# Altium schematic sheet PFC-Sheet.SchDoc (part 3 of 4)
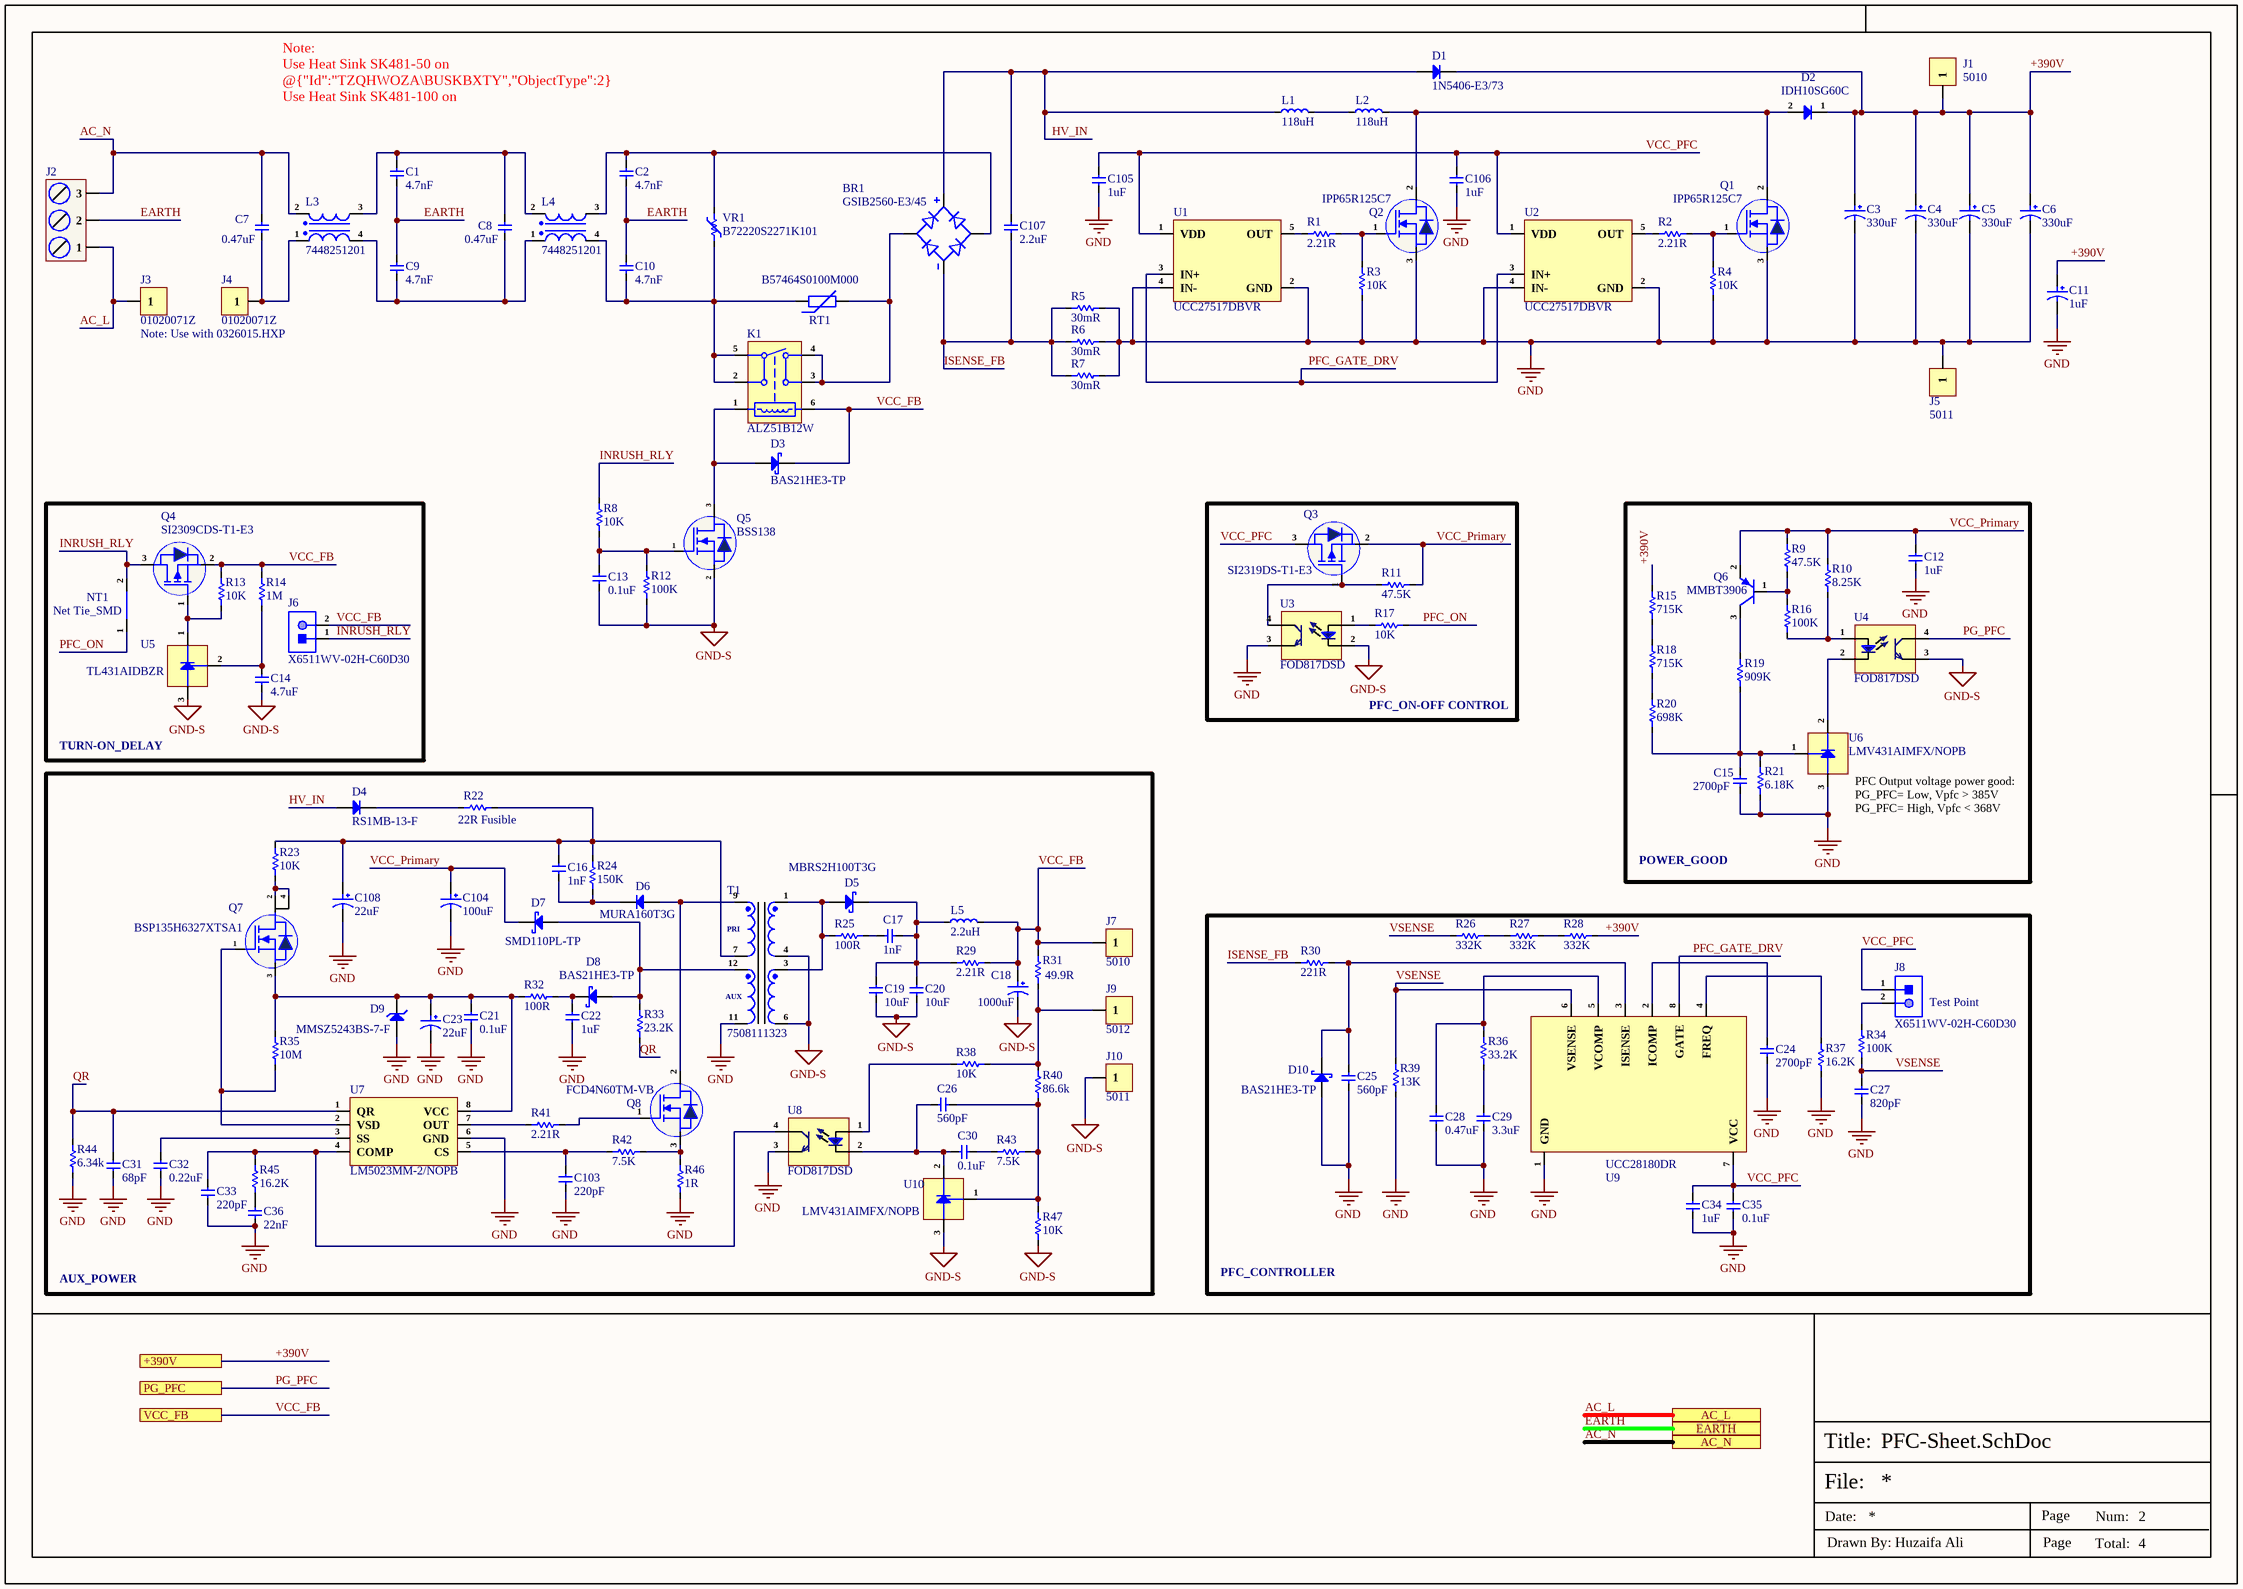
[diagram p2: PFC-Sheet.SchDoc]

## Library data of the parts (continued)
L1 L2 = 760801401: FIXED IND 118UH 13.9A 0.022OHM; Manufacturer: Wurth Electronics; Item Type: Inductors; Supplier: Digikey; Supplier Part Number: 732-760801401-ND; Manufacturer Part Number: 760801401; RoHS: No; Stock: 36; Pricing: 1=18.9, 5=17.01, 10=15.12, 20=14.175, 100=13.2301 (USD)
L3 L4 = 7448251201: CMC 1MH 12A 2LN TH; Manufacturer: Wurth Electronics; Item Type: Inductors; Supplier: Digikey; Supplier Part Number: 732-1454-ND; Manufacturer Part Number: 7448251201; RoHS: Yes; Stock: 1202; Pricing: 1=6.33, 10=6.23, 50=4.94, 175=4.73006, 350=4.6368 (USD); ComponentLink1URL: https://datasheet.ciiva.com/6216/7448251201-6216302.pdf?src-supplier=Digikey; ComponentLink1Description: https://datasheet.ciiva.com/6216/7448251201-6216302.pdf?src-supplier=Digikey; ComponentLink2URL: https://datasheet.ciiva.com/4952/7448251201-46375-4952324.pdf?src-supplier=Mouser; ComponentLink2Description: https://datasheet.ciiva.com/4952/7448251201-46375-4952324.pdf?src-supplier=Mouser; ComponentLink3URL: https://datasheet.ciiva.com/11796/0900766b804acf5b-11796661.pdf?src-supplier=Rs; ComponentLink3Description: https://datasheet.ciiva.com/11796/0900766b804acf5b-11796661.pdf?src-supplier=Rs; ComponentLink4URL: https://datasheet.ciiva.com/7754/1736539-7754744.pdf?src-supplier=Element14; ComponentLink4Description: https://datasheet.ciiva.com/7754/1736539-7754744.pdf?src-supplier=Element14; ComponentLink5URL: https://datasheet.ciiva.com/7211/70416-7211268.pdf?src-supplier=Newark; ComponentLink5Description: https://datasheet.ciiva.com/7211/70416-7211268.pdf?src-supplier=Newark; ComponentLink6URL: https://datasheet.ciiva.com/14124/ue7448251201-de-14124967.pdf?src-supplier=Distrelec; ComponentLink6Description: https://datasheet.ciiva.com/14124/ue7448251201-de-14124967.pdf?src-supplier=Distrelec
L5 = 7447745022: FIXED IND 2.2UH 3.6A 36 MOHM SMD; Manufacturer: Wurth Electronics; Item Type: Inductors; Supplier: Digikey; Manufacturer Part Number: 7447745022; RoHS: Yes; Stock: 1399; Pricing: 1=1.87, 10=1.791, 50=1.612, 100=1.492, 500=1.433, 1000=1.313 (USD); ComponentLink1URL: https://datasheet.ciiva.com/4954/7447745022-70534-4954819.pdf?src-supplier=Mouser; ComponentLink1Description: https://datasheet.ciiva.com/4954/7447745022-70534-4954819.pdf?src-supplier=Mouser; ComponentLink2URL: https://datasheet.ciiva.com/30489/0900766b811bf6b7-30489497.pdf?src-supplier=Rs; ComponentLink2Description: https://datasheet.ciiva.com/30489/0900766b811bf6b7-30489497.pdf?src-supplier=Rs; ComponentLink3URL: https://datasheet.ciiva.com/7892/1736408-7892891.pdf?src-supplier=Element14; ComponentLink3Description: https://datasheet.ciiva.com/7892/1736408-7892891.pdf?src-supplier=Element14; ComponentLink4URL: https://datasheet.ciiva.com/6700/7447745022-6700388.pdf?src-supplier=Digikey; ComponentLink4Description: https://datasheet.ciiva.com/6700/7447745022-6700388.pdf?src-supplier=Digikey; ComponentLink5URL: https://datasheet.ciiva.com/6700/7447745022-6700390.pdf?src-supplier=Digikey; ComponentLink5Description: https://datasheet.ciiva.com/6700/7447745022-6700390.pdf?src-supplier=Digikey
NT1 = Net Tie_SMD: Net Tie SMD; Manufacturer Part Number: Net Tie; Item Type: Net Tie Pad
Q1 Q2 = IPP65R125C7: MOSFET N-CH 650V 18A TO220-3; Manufacturer: Infineon; Supplier: Mouser; Manufacturer Part Number: IPP65R125C7; RoHS: Yes; Item Type: Mosfet; Pricing: 1=4.05, 10=3.4, 50=2.58, 100=2.35, 1000=1.88, 10000=1.88 (USD); ComponentLink1URL: http://www.farnell.com/datasheets/1812585.pdf?src-supplier=Element14; ComponentLink1Description: http://www.farnell.com/datasheets/1812585.pdf?src-supplier=Element14; ComponentLink2URL: http://www.farnell.com/datasheets/1812585.pdf?src-supplier=Newark; ComponentLink2Description: http://www.farnell.com/datasheets/1812585.pdf?src-supplier=Newark
Q3 = SI2319DS-T1-E3: MOSFET P-CH 40V 2.3A SOT23-3; Manufacturer: Vishay Siliconix; Item Type: MOSFETs; Drain to Source Breakdown Voltage: -40V; Supplier: Mouser; LCSC Part Number: C727531; Manufacturer Part Number: SI2319DS-T1-E3; RoHS: Yes; Stock: 200176; Pricing: 1=0.55, 10=0.466, 50=0.466, 100=0.359, 1000=0.296, 10000=0.237 (USD); Lead Free: 5697LeadFree; ComponentLink1URL: https://datasheet.ciiva.com/28599/1749956-28599616.pdf?src-supplier=Element14; ComponentLink1Description: https://datasheet.ciiva.com/28599/1749956-28599616.pdf?src-supplier=Element14; ComponentLink2URL: https://datasheet.ciiva.com/16486/72315-16486091.pdf?src-supplier=Future+Electronics; ComponentLink2Description: https://datasheet.ciiva.com/16486/72315-16486091.pdf?src-supplier=Future+Electronics; ComponentLink3URL: https://datasheet.ciiva.com/7788/72315-7788760.pdf?src-supplier=Element14; ComponentLink3Description: https://datasheet.ciiva.com/7788/72315-7788760.pdf?src-supplier=Element14; ComponentLink4URL: https://datasheet.ciiva.com/932/72315-932453.pdf?src-supplier=Digikey; ComponentLink4Description: https://datasheet.ciiva.com/932/72315-932453.pdf?src-supplier=Digikey; ComponentLink5URL: https://datasheet.ciiva.com/932/72315-932454.pdf?src-supplier=Digikey; ComponentLink5Description: https://datasheet.ciiva.com/932/72315-932454.pdf?src-supplier=Digikey; ComponentLink6URL: https://datasheet.ciiva.com/932/72315-932455.pdf?src-supplier=Digikey; ComponentLink6Description: https://datasheet.ciiva.com/932/72315-932455.pdf?src-supplier=Digikey; ComponentLink7URL: https://datasheet.ciiva.com/11161/72315-11161455.pdf?src-supplier=Avnet; ComponentLink7Description: https://datasheet.ciiva.com/11161/72315-11161455.pdf?src-supplier=Avnet
Q4 = SI2309CDS-T1-E3: MOSFET P-CH 60V 1.6A SOT23-3; Manufacturer: Vishay Siliconix; Item Type: MOSFETs; Rise Time: 35ns; Rds On Max: 345mR; Input Capacitance: 210pF; Continuous Drain Current (ID): 1.2A; Max Power Dissipation: 1.7W; Gate to Source Voltage (Vgs): 20V; Turn-Off Delay Time: 15ns; Turn-On Delay Time: 40ns; Number of Channels: 1; Polarity: P-CHANNEL; Power Dissipation: 1W; Threshold Voltage: -1V; Supplier: Mouser; LCSC Part Number: C553975; Manufacturer Part Number: SI2309CDS-T1-E3; RoHS: Yes; Stock: 57582; Pricing: 1=0.53, 10=0.453, 50=0.453, 100=0.316, 1000=0.2, 10000=0.157 (USD); Mounting Technology: Surface Mount; Case/Package: SOT-23-3; Pins: 3; Weight: 0.050717oz; Min Operating Temperature: -55°C; Max Operating Temperature: 150°C; Packaging: Tape and Reel; Package Quantity: 3000; Drain to Source Voltage (Vdss): 60V; Drain to Source Resistance: 345mR; Fall Time: 35ns; Series: TrenchFET®; Drain-source On Resistance-Max: 345mR; Length: 3.04mm; Width: 1.4mm; Height: 1.02mm; Radiation Hardening: No; Lead Free: Lead Free; RoHS Compliant: Yes; ComponentLink1URL: https://datasheet.ciiva.com/16217/si2309cd-16217597.pdf?src-supplier=Future+Electronics; ComponentLink1Description: https://datasheet.ciiva.com/16217/si2309cd-16217597.pdf?src-supplier=Future+Electronics; ComponentLink2URL: https://datasheet.ciiva.com/29742/si2309cd-29742879.pdf?src-supplier=Digikey; ComponentLink2Description: https://datasheet.ciiva.com/29742/si2309cd-29742879.pdf?src-supplier=Digikey
Q5 = BSS138: 50V 220mA 3.5Ω@10V,220mA 225mW 1.6V@1mA N Channel SOT-23 MOSFETs ROHS; Manufacturer: Slkor(SLKORMICRO Elec.); Item Type: Mosfet; Manufacturer Part Number: BSS138; Package: SOT-23; LCSC Part Number: C426569; ComponentLink1Description: LCSC; ComponentLink1URL: https://www.lcsc.com/product-detail/MOSFETs_Slkor-SLKORMICRO-Elec-BSS138_C426569.html
Q6 = MMBT3906: 40V 300mW 200mA PNP SOT-23(TO-236) Bipolar Transistors - BJT ROHS; Manufacturer: YONGYUTAI; Manufacturer Part Number: MMBT3906; Package: SOT-23(TO-236); LCSC Part Number: C2891809; ComponentLink1Description: LCSC; ComponentLink1URL: https://www.lcsc.com/product-detail/Bipolar-Transistors-BJT_YONGYUTAI-MMBT3906_C2891809.html; Item Type: Transistor
Q7 = BSP135H6327XTSA1: Trans MOSFET N-CH 600V 0.12A Automotive 4-Pin(3+Tab) SOT-223; Manufacturer: Infineon; Item Type: MOSFETs; Supplier: Mouser; LCSC Part Number: C3278599; Manufacturer Part Number: BSP135H6327XTSA1; RoHS: Yes; Stock: 85947; Pricing: 1=1.31, 10=1.08, 50=1.08, 100=0.837, 1000=0.577, 10000=0.563 (USD)
Q8 = FCD4N60TM-VB: 650V 5A 950mΩ@10V 1 N-Channel TO-252 MOSFETs ROHS; Manufacturer: VBsemi Elec; Manufacturer Part Number: FCD4N60TM-VB; Package: TO-252; LCSC Part Number: C20755211; Item Type: MOSFETs; ComponentLink1Description: LCSC; ComponentLink1URL: https://www.lcsc.com/product-detail/MOSFETs_VBsemi-Elec-FCD4N60TM-VB_C20755211.html
R1 R2 R29 R41 = CRCW08052R21FKEA: RES SMD 2.21 OHM 1% 1/8W 0805; Manufacturer: Vishay Dale; Item Type: Resistor; Voltage Rating (DC): 150V; Supplier: Mouser; LCSC Part Number: C2085884; Manufacturer Part Number: CRCW08052R21FKEA; RoHS: Yes; Stock: 740; Pricing: 1=0.1, 10=0.033, 50=0.033, 100=0.02, 1000=0.015, 10000=0.01 (USD); Lead Free: 5697LeadFree; ComponentLink1URL: https://datasheet.ciiva.com/9090/dcrcwe3-9090039.pdf?src-supplier=Avnet; ComponentLink1Description: https://datasheet.ciiva.com/9090/dcrcwe3-9090039.pdf?src-supplier=Avnet; ComponentLink2URL: https://datasheet.ciiva.com/5588/dcrcwe3-109170-5588315.pdf?src-supplier=Mouser; ComponentLink2Description: https://datasheet.ciiva.com/5588/dcrcwe3-109170-5588315.pdf?src-supplier=Mouser; ComponentLink3URL: https://datasheet.ciiva.com/2467/dcrcwe3-2467362.pdf?src-supplier=Digikey; ComponentLink3Description: https://datasheet.ciiva.com/2467/dcrcwe3-2467362.pdf?src-supplier=Digikey; ComponentLink4URL: https://datasheet.ciiva.com/2467/dcrcwe3-2467363.pdf?src-supplier=Digikey; ComponentLink4Description: https://datasheet.ciiva.com/2467/dcrcwe3-2467363.pdf?src-supplier=Digikey; ComponentLink5URL: https://datasheet.ciiva.com/2467/dcrcwe3-2467364.pdf?src-supplier=Digikey; ComponentLink5Description: https://datasheet.ciiva.com/2467/dcrcwe3-2467364.pdf?src-supplier=Digikey
R3 R4 R8 R13 R17 R38 R47 = RK73G1JTTD1002F: RES 10K OHM 1% 1/10W 0603; Item Type: Resistor; Value: 10kR; Power Rating: 100mW; Voltage Rating: 75V; Temperature Coefficient: 50ppm/°C; LCSC Part Number: C362180; ComponentLink1Description: LCSC; Supplier: Digi-Key; Supplier Part Number: 2019-RK73G1JTTD1002FCT-ND; RoHS: Yes; Category: Chip SMD Resistors; Stock: 249394; Pricing: 1=0.22, 10=0.118, 50=0.0812, 100=0.0699, 500=0.0513, 1000=0.04545 (USD); Case/Package: 0603; Case Code (Imperial): 0603; Case Code (Metric): 1608; Min Operating Temperature: -55°C; Max Operating Temperature: 125°C; Tolerance: 1%; Packaging: Tape and Reel; Termination: SMD/SMT; Series: RK73G; Construction: Rectangular; Length: 1.6mm; Depth: 0.8mm; Military Standard: Not; RoHS Compliant: Yes; ComponentLink2URL: http://www.mouser.com/ds/2/219/RK73G-9863.pdf?src-supplier=Mouser; ComponentLink2Description: http://www.mouser.com/ds/2/219/RK73G-9863.pdf?src-supplier=Mouser
R5-R7 = PA2512FKE7W0R03E: RES 0.03 OHM 1% 2W 2512; Manufacturer: Yageo; Item Type: Resistor; Supplier: Avnet; LCSC Part Number: C728311; Manufacturer Part Number: PA2512FKE7W0R03E; RoHS: No; Stock: 4000; Pricing: 1=0.655, 25=0.542, 50=0.453, 100=0.364, 250=0.314 (USD)
R9 = CRCW060347K5FKEA: RES SMD 47.5K OHM 1% 1/10W 0603; Manufacturer: Vishay; Item Type: Resistors; Value: 47.5kR; Temperature Coefficient: 100ppm/°C; Max Power Dissipation: 100mW; Voltage Rating: 75V; Supplier: Mouser; LCSC Part Number: C844568; Manufacturer Part Number: CRCW060347K5FKEA; RoHS: Yes; Stock: 130545; Pricing: 1=0.1, 10=0.016, 50=0.016, 100=0.01, 1000=0.009, 10000=0.004 (USD); Case/Package: 0603; Weight: 7.1E-05oz; Case Code (Imperial): 0603; Case Code (Metric): 1608; Contact Plating: Tin; Min Operating Temperature: -55°C; Max Operating Temperature: 155°C; Tolerance: 1%; Packaging: Tape and Reel; Package Quantity: 10; Number of Terminations: 2; Features: Automotive AEC-Q200; Series: CRCW; Power Rating: 100mW; Resistor Type: Thick Film; Termination: SMD/SMT; Resistance Tolerance: 1%; Construction: Rectangular; Technology: THICK FILM; Voltage Rating (DC): 75V; Length: 1.55mm; Width: 0.033inch; Height: 0.45mm; Depth: 0.85mm; Radiation Hardening: No; RoHS Compliant: Yes; Military Standard: Not; Reach SVHC Compliant: Unknown; ComponentLink1URL: https://datasheet.ciiva.com/11810/0900766b80d98afc-11810543.pdf?src-supplier=Rs; ComponentLink1Description: https://datasheet.ciiva.com/11810/0900766b80d98afc-11810543.pdf?src-supplier=Rs; ComponentLink2URL: https://datasheet.ciiva.com/7841/1697337-7841832.pdf?src-supplier=Element14; ComponentLink2Description: https://datasheet.ciiva.com/7841/1697337-7841832.pdf?src-supplier=Element14; ComponentLink3URL: https://datasheet.ciiva.com/7841/125364-7841833.pdf?src-supplier=Element14; ComponentLink3Description: https://datasheet.ciiva.com/7841/125364-7841833.pdf?src-supplier=Element14; ComponentLink4URL: https://datasheet.ciiva.com/2465/dcrcwe3-2465817.pdf?src-supplier=Digikey; ComponentLink4Description: https://datasheet.ciiva.com/2465/dcrcwe3-2465817.pdf?src-supplier=Digikey; ComponentLink5URL: https://datasheet.ciiva.com/2465/dcrcwe3-2465818.pdf?src-supplier=Digikey; ComponentLink5Description: https://datasheet.ciiva.com/2465/dcrcwe3-2465818.pdf?src-supplier=Digikey; ComponentLink6URL: https://datasheet.ciiva.com/2465/dcrcwe3-2465816.pdf?src-supplier=Digikey; ComponentLink6Description: https://datasheet.ciiva.com/2465/dcrcwe3-2465816.pdf?src-supplier=Digikey; ComponentLink7URL: https://datasheet.ciiva.com/16769/70201119-16769373.pdf?src-supplier=Allied+Electronics; ComponentLink7Description: https://datasheet.ciiva.com/16769/70201119-16769373.pdf?src-supplier=Allied+Electronics
R10 = CRCW06038K25FKEA: RES SMD 8.25K OHM 1% 1/10W 0603; Manufacturer: Vishay; Item Type: Resistors; Voltage Rating (DC): 75V; Supplier: Mouser; LCSC Part Number: C843969; Manufacturer Part Number: CRCW06038K25FKEA; RoHS: Yes; Stock: 19942; Pricing: 1=0.1, 10=0.017, 50=0.017, 100=0.01, 1000=0.008, 10000=0.005 (USD); Lead Free: 5697LeadFree; ComponentLink1URL: https://datasheet.ciiva.com/11810/0900766b80d98afc-11810884.pdf?src-supplier=Rs; ComponentLink1Description: https://datasheet.ciiva.com/11810/0900766b80d98afc-11810884.pdf?src-supplier=Rs; ComponentLink2URL: https://datasheet.ciiva.com/5550/dcrcwe3-109170-5550394.pdf?src-supplier=Mouser; ComponentLink2Description: https://datasheet.ciiva.com/5550/dcrcwe3-109170-5550394.pdf?src-supplier=Mouser; ComponentLink3URL: https://datasheet.ciiva.com/16762/70201119-16762982.pdf?src-supplier=Allied+Electronics; ComponentLink3Description: https://datasheet.ciiva.com/16762/70201119-16762982.pdf?src-supplier=Allied+Electronics; ComponentLink4URL: https://datasheet.ciiva.com/22869/70201119-22869848.pdf?src-supplier=Allied+Electronics; ComponentLink4Description: https://datasheet.ciiva.com/22869/70201119-22869848.pdf?src-supplier=Allied+Electronics; ComponentLink5URL: https://datasheet.ciiva.com/7679/1697337-7679147.pdf?src-supplier=Element14; ComponentLink5Description: https://datasheet.ciiva.com/7679/1697337-7679147.pdf?src-supplier=Element14; ComponentLink6URL: https://datasheet.ciiva.com/16427/dcrcwe3-16427340.pdf?src-supplier=Future+Electronics; ComponentLink6Description: https://datasheet.ciiva.com/16427/dcrcwe3-16427340.pdf?src-supplier=Future+Electronics; ComponentLink7URL: https://datasheet.ciiva.com/2494/dcrcwe3-2494900.pdf?src-supplier=Digikey; ComponentLink7Description: https://datasheet.ciiva.com/2494/dcrcwe3-2494900.pdf?src-supplier=Digikey; ComponentLink8URL: https://datasheet.ciiva.com/2494/dcrcwe3-2494901.pdf?src-supplier=Digikey; ComponentLink8Description: https://datasheet.ciiva.com/2494/dcrcwe3-2494901.pdf?src-supplier=Digikey; ComponentLink9URL: https://datasheet.ciiva.com/2494/dcrcwe3-2494902.pdf?src-supplier=Digikey; ComponentLink9Description: https://datasheet.ciiva.com/2494/dcrcwe3-2494902.pdf?src-supplier=Digikey
R11 = RC0603FR-0747K5L: RES 47.5K OHM 1% 1/10W 0603; Manufacturer: Yageo; Resistance: 47.5kR; Power Rating: 100mW; Voltage Rating: 50V; Temperature Coefficient: 100ppm/°C; Item Type: Resistor; Supplier 1: Avnet; Manufacturer Part Number: RC0603FR-0747K5L; RoHS: Yes; Category: Chip SMD Resistors; Stock 1: 20000; Pricing 1: 5000=0.00133, 10000=0.00131, 20000=0.00127 (USD); Case/Package: 0603; Number of Pins: 2; Case Code (Metric): 1608; Case Code (Imperial): 0603; Size Code: 0603; Min Operating Temperature: -55°C; Max Operating Temperature: 155°C; Tolerance: 1%; Package Quantity: 5000; Packaging: Tape and Reel; Resistor Type: Thick Film; Number of Terminations: 2; Termination: SMD/SMT; Max Power Dissipation: 100mW; Voltage Rating (DC): 50V; Features: Moisture Resistant; Series: RC; Technology: THICK FILM; Construction: Rectangular; Resistance Tolerance: 1%; Length: 1.6mm; Width: 0.031inch; Height: 0.45mm; Depth: 0.8mm; RoHS Compliant: Yes; Reach SVHC Compliant: Yes; Military Standard: Not; Lead Free: Lead Free; ComponentLink1URL: https://datasheet.ciiva.com/11808/0900766b80f96399-11808343.pdf?src-supplier=RSComponents; ComponentLink1Description: https://datasheet.ciiva.com/11808/0900766b80f96399-11808343.pdf?src-supplier=RSComponents; ComponentLink2URL: https://datasheet.ciiva.com/2454/pyu-r-int-thick-7-2454790.pdf?src-supplier=Digi-Key; ComponentLink2Description: https://datasheet.ciiva.com/2454/pyu-r-int-thick-7-2454790.pdf?src-supplier=Digi-Key; ComponentLink3URL: https://datasheet.ciiva.com/2454/pyu-r-int-thick-7-2454791.pdf?src-supplier=Digi-Key; ComponentLink3Description: https://datasheet.ciiva.com/2454/pyu-r-int-thick-7-2454791.pdf?src-supplier=Digi-Key; ComponentLink4URL: https://datasheet.ciiva.com/2454/pyu-r-int-thick-7-2454789.pdf?src-supplier=Digi-Key; ComponentLink4Description: https://datasheet.ciiva.com/2454/pyu-r-int-thick-7-2454789.pdf?src-supplier=Digi-Key; ComponentLink5URL: https://datasheet.ciiva.com/12555/rc0603-272842-12555285.pdf?src-supplier=Mouser; ComponentLink5Description: https://datasheet.ciiva.com/12555/rc0603-272842-12555285.pdf?src-supplier=Mouser; ComponentLink6URL: https://datasheet.ciiva.com/15189/getdatasheetpartid-135115-15189741.pdf?src-supplier=Verical; ComponentLink6Description: https://datasheet.ciiva.com/15189/getdatasheetpartid-135115-15189741.pdf?src-supplier=Verical; Supplier Part Number 1: RC0603FR-0747K5L; LCSC Part Number: C137715
R12 R16 R34 = CRCW0603100KFKEA: RES SMD 100K OHM 1% 1/10W 0603; Item Type: Resistor; Value: 100kR; Temperature Coefficient: 100ppm/°C; Voltage Rating: 75V; Power Rating: 100mW; ComponentLink1Description: LCSC; Supplier: Mouser; Supplier Part Number: 71-CRCW0603-100K-E3; RoHS: Yes; Category: Chip SMD Resistors; Stock: 716604; Pricing: 1=0.1, 10=0.019, 50=0.019, 100=0.009, 1000=0.007, 10000=0.004 (USD); Case/Package: 345Case; Pins: 2NUMBER; Case Code (Imperial): 0603; Case Code (Metric): 1608; Min Operating Temperature: -55°C; Max Operating Temperature: 155°C; Tolerance: 1%; Resistor Type: Thick Film; Resistance Tolerance: 1%; Packaging: 13Packaging; Voltage Rating (DC): 75V; Features: 6309FeaturesType; Height: 500um; RoHS Compliant: Yes; Lead Free: 5697LeadFree; ComponentLink2URL: http://www.farnell.com/datasheets/2310790.pdf?src-supplier=Farnell; ComponentLink2Description: http://www.farnell.com/datasheets/2310790.pdf?src-supplier=Farnell; ComponentLink3URL: https://datasheet.octopart.com/CRCW0603100KFKEA-Vishay-datasheet-14722531.pdf?src-supplier=Newark; ComponentLink3Description: https://datasheet.octopart.com/CRCW0603100KFKEA-Vishay-datasheet-14722531.pdf?src-supplier=Newark; ComponentLink4URL: https://www.vishay.com/docs/20035/dcrcwe3.pdf?src-supplier=Digi-Key; ComponentLink4Description: https://www.vishay.com/docs/20035/dcrcwe3.pdf?src-supplier=Digi-Key; ComponentLink5URL: https://datasheet.octopart.com/CRCW0603100KFKEA-Vishay-datasheet-5300368.pdf?src-supplier=Future+Electronics; ComponentLink5Description: https://datasheet.octopart.com/CRCW0603100KFKEA-Vishay-datasheet-5300368.pdf?src-supplier=Future+Electronics; ComponentLink6URL: http://www.farnell.com/datasheets/2310790.pdf?src-supplier=Newark; ComponentLink6Description: http://www.farnell.com/datasheets/2310790.pdf?src-supplier=Newark; ComponentLink7URL: http://www.farnell.com/datasheets/2310790.pdf?src-supplier=Element14; ComponentLink7Description: http://www.farnell.com/datasheets/2310790.pdf?src-supplier=Element14; ComponentLink8URL: https://datasheet.octopart.com/CRCW0603100KFKEA-Vishay-datasheet-83961561.pdf?src-supplier=Element14; ComponentLink8Description: https://datasheet.octopart.com/CRCW0603100KFKEA-Vishay-datasheet-83961561.pdf?src-supplier=Element14; ComponentLink9URL: https://datasheet.octopart.com/CRCW0603100KFKEA-Vishay-datasheet-8363642.pdf?src-supplier=Verical; ComponentLink9Description: https://datasheet.octopart.com/CRCW0603100KFKEA-Vishay-datasheet-8363642.pdf?src-supplier=Verical; ComponentLink10URL: https://datasheet.octopart.com/CRCW0603100KFKEA-Vishay-datasheet-508714.pdf?src-supplier=Farnell; ComponentLink10Description: https://datasheet.octopart.com/CRCW0603100KFKEA-Vishay-datasheet-508714.pdf?src-supplier=Farnell; ComponentLink11URL: https://datasheet.octopart.com/CRCW0603100KFKEA-Vishay-datasheet-17834126.pdf?src-supplier=TME; ComponentLink11Description: https://datasheet.octopart.com/CRCW0603100KFKEA-Vishay-datasheet-17834126.pdf?src-supplier=TME; LCSC Part Number: C844916
R14 = RC0805FR-071ML: RES 1M OHM 1% 1/8W 0805; Manufacturer: Yageo; Value: 1MR; Power Rating: 125mW; Temperature Coefficient: 250ppm/°C; Voltage Rating: 150V; Item Type: Resistor; Supplier: Future Electronics; Supplier Part Number: 7283393; Manufacturer Part Number: RC0805FR-071ML; RoHS: Yes; Category: Chip SMD Resistors; Stock: 2655000; Pricing: 5000=0.0027, 25000=0.0025, 125000=0.0024, 500000=0.0023, 1250000=0.0021 (USD); Case/Package: Molded; Case Code (Metric): 2012; Case Code (Imperial): 0805; Min Operating Temperature: -55°C; Max Operating Temperature: 155°C; Resistor Type: Thick Film; Tolerance: 1%; Packaging: Tape and Reel; Construction: Rectangular; Resistance Tolerance: 1%; Voltage Rating (AC): 150V; Length: 2mm; Depth: 1.25mm; Lead Free: Lead Free; RoHS Compliant: Yes; Reach SVHC Compliant: Unknown; Military Standard: Not; LCSC Part Number: C107700
R15 R18 = CRCW1206715KFKEA: RES SMD 715K OHM 1% 1/4W 1206; Manufacturer: Vishay; Item Type: Resistor; Voltage Rating (DC): 200V; Supplier: Mouser; LCSC Part Number: C4055418; Manufacturer Part Number: CRCW1206715KFKEA; RoHS: Yes; Stock: 11531; Pricing: 1=0.1, 10=0.029, 50=0.029, 100=0.018, 1000=0.015, 10000=0.007 (USD); Pins: 2NUMBER; ComponentLink1URL: https://datasheet.ciiva.com/5541/dcrcwe3-109170-5541198.pdf?src-supplier=Mouser; ComponentLink1Description: https://datasheet.ciiva.com/5541/dcrcwe3-109170-5541198.pdf?src-supplier=Mouser; ComponentLink2URL: https://datasheet.ciiva.com/7670/1697337-7670986.pdf?src-supplier=Element14; ComponentLink2Description: https://datasheet.ciiva.com/7670/1697337-7670986.pdf?src-supplier=Element14; ComponentLink3URL: https://datasheet.ciiva.com/7670/1697337-7670987.pdf?src-supplier=Element14; ComponentLink3Description: https://datasheet.ciiva.com/7670/1697337-7670987.pdf?src-supplier=Element14; ComponentLink4URL: https://datasheet.ciiva.com/2515/dcrcwe3-2515762.pdf?src-supplier=Digikey; ComponentLink4Description: https://datasheet.ciiva.com/2515/dcrcwe3-2515762.pdf?src-supplier=Digikey; ComponentLink5URL: https://datasheet.ciiva.com/2515/dcrcwe3-2515760.pdf?src-supplier=Digikey; ComponentLink5Description: https://datasheet.ciiva.com/2515/dcrcwe3-2515760.pdf?src-supplier=Digikey; ComponentLink6URL: https://datasheet.ciiva.com/2515/dcrcwe3-2515761.pdf?src-supplier=Digikey; ComponentLink6Description: https://datasheet.ciiva.com/2515/dcrcwe3-2515761.pdf?src-supplier=Digikey
R19 = CRCW0603909KFKEA: RES SMD 909K OHM 1% 1/10W 0603; Manufacturer: Vishay; Item Type: Resistors; Voltage Rating (DC): 75V; Supplier: Mouser; LCSC Part Number: C2076687; Manufacturer Part Number: CRCW0603909KFKEA; RoHS: Yes; Stock: 17715; Pricing: 1=0.1, 10=0.017, 50=0.017, 100=0.01, 1000=0.008, 10000=0.005 (USD); Pins: 2NUMBER; Lead Free: 5697LeadFree; ComponentLink1URL: https://datasheet.ciiva.com/11809/0900766b80d98afc-11809763.pdf?src-supplier=Rs; ComponentLink1Description: https://datasheet.ciiva.com/11809/0900766b80d98afc-11809763.pdf?src-supplier=Rs; ComponentLink2URL: https://datasheet.ciiva.com/3257/dcrcwe3-3257961.pdf?src-supplier=Avnet; ComponentLink2Description: https://datasheet.ciiva.com/3257/dcrcwe3-3257961.pdf?src-supplier=Avnet; ComponentLink3URL: https://datasheet.ciiva.com/3257/dcrcwe3-3257962.pdf?src-supplier=Avnet; ComponentLink3Description: https://datasheet.ciiva.com/3257/dcrcwe3-3257962.pdf?src-supplier=Avnet; ComponentLink4URL: https://datasheet.ciiva.com/5547/dcrcwe3-109170-5547079.pdf?src-supplier=Mouser; ComponentLink4Description: https://datasheet.ciiva.com/5547/dcrcwe3-109170-5547079.pdf?src-supplier=Mouser; ComponentLink5URL: https://datasheet.ciiva.com/2466/dcrcwe3-2466108.pdf?src-supplier=Digikey; ComponentLink5Description: https://datasheet.ciiva.com/2466/dcrcwe3-2466108.pdf?src-supplier=Digikey; ComponentLink6URL: https://datasheet.ciiva.com/2466/dcrcwe3-2466109.pdf?src-supplier=Digikey; ComponentLink6Description: https://datasheet.ciiva.com/2466/dcrcwe3-2466109.pdf?src-supplier=Digikey; ComponentLink7URL: https://datasheet.ciiva.com/7670/1697337-7670567.pdf?src-supplier=Element14; ComponentLink7Description: https://datasheet.ciiva.com/7670/1697337-7670567.pdf?src-supplier=Element14; ComponentLink8URL: https://datasheet.ciiva.com/7670/1697337-7670566.pdf?src-supplier=Element14; ComponentLink8Description: https://datasheet.ciiva.com/7670/1697337-7670566.pdf?src-supplier=Element14; ComponentLink9URL: https://datasheet.ciiva.com/22708/1697337-22708085.pdf?src-supplier=Element14; ComponentLink9Description: https://datasheet.ciiva.com/22708/1697337-22708085.pdf?src-supplier=Element14; ComponentLink10URL: https://datasheet.ciiva.com/2466/dcrcwe3-2466107.pdf?src-supplier=Digikey; ComponentLink10Description: https://datasheet.ciiva.com/2466/dcrcwe3-2466107.pdf?src-supplier=Digikey; ComponentLink11URL: https://datasheet.ciiva.com/16397/dcrcwe3-16397319.pdf?src-supplier=Future+Electronics; ComponentLink11Description: https://datasheet.ciiva.com/16397/dcrcwe3-16397319.pdf?src-supplier=Future+Electronics; ComponentLink12URL: https://datasheet.ciiva.com/16785/70201119-16785116.pdf?src-supplier=Allied+Electronics; ComponentLink12Description: https://datasheet.ciiva.com/16785/70201119-16785116.pdf?src-supplier=Allied+Electronics; ComponentLink13URL: https://datasheet.ciiva.com/22869/70201119-22869532.pdf?src-supplier=Allied+Electronics; ComponentLink13Description: https://datasheet.ciiva.com/22869/70201119-22869532.pdf?src-supplier=Allied+Electronics
R20 = CRCW1206698KFKEA: RES SMD 698K OHM 1% 1/4W 1206; Manufacturer: Vishay; Item Type: Resistors; Supplier: Mouser; LCSC Part Number: C4220825; Manufacturer Part Number: CRCW1206698KFKEA; RoHS: Yes; Stock: 11383; Pricing: 1=0.1, 10=0.032, 50=0.032, 100=0.019, 1000=0.014, 10000=0.009 (USD); ComponentLink1URL: https://datasheet.ciiva.com/7670/1697337-7670984.pdf?src-supplier=Element14; ComponentLink1Description: https://datasheet.ciiva.com/7670/1697337-7670984.pdf?src-supplier=Element14; ComponentLink2URL: https://datasheet.ciiva.com/7670/1697337-7670985.pdf?src-supplier=Element14; ComponentLink2Description: https://datasheet.ciiva.com/7670/1697337-7670985.pdf?src-supplier=Element14; ComponentLink3URL: https://datasheet.ciiva.com/5545/dcrcwe3-109170-5545580.pdf?src-supplier=Mouser; ComponentLink3Description: https://datasheet.ciiva.com/5545/dcrcwe3-109170-5545580.pdf?src-supplier=Mouser; ComponentLink4URL: https://datasheet.ciiva.com/8922/dcrcwe3-8922742.pdf?src-supplier=Avnet; ComponentLink4Description: https://datasheet.ciiva.com/8922/dcrcwe3-8922742.pdf?src-supplier=Avnet; ComponentLink5URL: https://datasheet.ciiva.com/2497/dcrcwe3-2497567.pdf?src-supplier=Digikey; ComponentLink5Description: https://datasheet.ciiva.com/2497/dcrcwe3-2497567.pdf?src-supplier=Digikey; ComponentLink6URL: https://datasheet.ciiva.com/2497/dcrcwe3-2497568.pdf?src-supplier=Digikey; ComponentLink6Description: https://datasheet.ciiva.com/2497/dcrcwe3-2497568.pdf?src-supplier=Digikey; ComponentLink7URL: https://datasheet.ciiva.com/2497/dcrcwe3-2497569.pdf?src-supplier=Digikey; ComponentLink7Description: https://datasheet.ciiva.com/2497/dcrcwe3-2497569.pdf?src-supplier=Digikey
R21 = CRCW06036K81FKEA: RES SMD 6.81K OHM 1% 1/10W 0603; Manufacturer: Vishay; Item Type: Resistor; Voltage Rating (DC): 75V; Supplier: Digikey; LCSC Part Number: C2076645; Manufacturer Part Number: CRCW06036K81FKEA; RoHS: Yes; Stock: 6285; Pricing: 1=0.1, 10=0.027, 50=0.0166, 100=0.0138, 500=0.00934, 1000=0.00802 (USD); Lead Free: 5697LeadFree; ComponentLink1URL: https://datasheet.ciiva.com/11810/0900766b80d98afc-11810987.pdf?src-supplier=Rs; ComponentLink1Description: https://datasheet.ciiva.com/11810/0900766b80d98afc-11810987.pdf?src-supplier=Rs; ComponentLink2URL: https://datasheet.ciiva.com/3257/dcrcwe3-3257855.pdf?src-supplier=Avnet; ComponentLink2Description: https://datasheet.ciiva.com/3257/dcrcwe3-3257855.pdf?src-supplier=Avnet; ComponentLink3URL: https://datasheet.ciiva.com/2525/dcrcwe3-2525326.pdf?src-supplier=Digikey; ComponentLink3Description: https://datasheet.ciiva.com/2525/dcrcwe3-2525326.pdf?src-supplier=Digikey; ComponentLink4URL: https://datasheet.ciiva.com/2525/dcrcwe3-2525327.pdf?src-supplier=Digikey; ComponentLink4Description: https://datasheet.ciiva.com/2525/dcrcwe3-2525327.pdf?src-supplier=Digikey; ComponentLink5URL: https://datasheet.ciiva.com/2525/dcrcwe3-2525328.pdf?src-supplier=Digikey; ComponentLink5Description: https://datasheet.ciiva.com/2525/dcrcwe3-2525328.pdf?src-supplier=Digikey; ComponentLink6URL: https://datasheet.ciiva.com/7673/1697337-7673318.pdf?src-supplier=Element14; ComponentLink6Description: https://datasheet.ciiva.com/7673/1697337-7673318.pdf?src-supplier=Element14; ComponentLink7URL: https://datasheet.ciiva.com/7673/1533075-7673470.pdf?src-supplier=Element14; ComponentLink7Description: https://datasheet.ciiva.com/7673/1533075-7673470.pdf?src-supplier=Element14; ComponentLink8URL: https://datasheet.ciiva.com/15159/getdatasheetpartid-67733-15159675.pdf?src-supplier=Verical; ComponentLink8Description: https://datasheet.ciiva.com/15159/getdatasheetpartid-67733-15159675.pdf?src-supplier=Verical; ComponentLink9URL: https://datasheet.ciiva.com/16758/70201119-16758917.pdf?src-supplier=Allied+Electronics; ComponentLink9Description: https://datasheet.ciiva.com/16758/70201119-16758917.pdf?src-supplier=Allied+Electronics
R22 = EMC2-22RKI: Res Metal Film 22 Ohm 10% 2W ±100ppm/C Conformal Coated AXL Ammo; Manufacturer: TT Welwyn; Item Type: Resistor; Voltage Rating: 500V; Temperature Coefficient: 100ppm/°C; Lead Length: 27mm; Supplier: Arrow Electronics; Supplier Part Number: EMC2-22RKI; Manufacturer Part Number: EMC2-22RKI; RoHS: Yes; Stock: 48000; Pricing: 2000=0.137, 10000=0.1282, 24000=0.1271, 50000=0.1192 (USD); Case/Package: Axial; Min Operating Temperature: -55°C; Max Operating Temperature: 155°C; Package Quantity: 1; Value: 22R; Power Rating: 2W; Tolerance: 10%; Packaging: Cut Tape; Resistor Type: Metal Film; Number of Terminations: 2; Max Power Dissipation: 2W; Voltage Rating (DC): 500V; Series: EMC; Resistance Tolerance: 10%; Length: 0.394inch; Reach SVHC Compliant: No; RoHS Compliant: Yes; ComponentLink1URL: https://datasheet.ciiva.com/2717/emc-2717106.pdf?src-supplier=Digikey; ComponentLink1Description: https://datasheet.ciiva.com/2717/emc-2717106.pdf?src-supplier=Digikey; ComponentLink2URL: https://datasheet.ciiva.com/2717/emc-2717107.pdf?src-supplier=Digikey; ComponentLink2Description: https://datasheet.ciiva.com/2717/emc-2717107.pdf?src-supplier=Digikey
R23 = CRCW251210K0FKEGHP: RES SMD 10K OHM 1% 1.5W 2512; Manufacturer: Vishay Dale; Item Type: Resistors; Value: 10kR; Voltage Rating: 500V; Temperature Coefficient: 100ppm/°C; Supplier: Mouser; LCSC Part Number: C2075694; Manufacturer Part Number: CRCW251210K0FKEGHP; RoHS: Yes; Stock: 1890; Pricing: 1=0.53, 10=0.441, 50=0.441, 100=0.382, 1000=0.257, 10000=0.189 (USD); Case/Package: 2512; Weight: 0.001482oz; Case Code (Imperial): 2512; Case Code (Metric): 6432; Contact Plating: Tin; Min Operating Temperature: -55°C; Max Operating Temperature: 155°C; Tolerance: 1%; Power Rating: 1.5W; Packaging: Tape and Reel; Package Quantity: 2000; Features: Automotive AEC-Q200; Series: CRCW-HP; Max Power Dissipation: 1.5W; Number of Terminations: 2; Length: 6.3mm; Width: 3.2mm; Height: 0.6mm; Ratings: AEC-Q200; Radiation Hardening: No; Lead Free: Lead Free; RoHS Compliant: Yes; ComponentLink1URL: https://datasheet.ciiva.com/5549/crcwhpe3-46056-5549613.pdf?src-supplier=Mouser; ComponentLink1Description: https://datasheet.ciiva.com/5549/crcwhpe3-46056-5549613.pdf?src-supplier=Mouser; ComponentLink2URL: https://datasheet.ciiva.com/9051/crcwhpe3-9051373.pdf?src-supplier=Avnet; ComponentLink2Description: https://datasheet.ciiva.com/9051/crcwhpe3-9051373.pdf?src-supplier=Avnet
R24 = CRCW2010150KFKEF: RES SMD 150K OHM 1% 3/4W 2010; Manufacturer: Vishay Dale; Item Type: Resistors; Supplier: Mouser; LCSC Part Number: C3008959; Manufacturer Part Number: CRCW2010150KFKEF; RoHS: Yes; Stock: 9918; Pricing: 1=0.24, 10=0.093, 50=0.093, 100=0.059, 1000=0.051, 10000=0.033 (USD); ComponentLink1URL: https://datasheet.ciiva.com/16426/dcrcwe3-16426669.pdf?src-supplier=Future+Electronics; ComponentLink1Description: https://datasheet.ciiva.com/16426/dcrcwe3-16426669.pdf?src-supplier=Future+Electronics; ComponentLink2URL: https://datasheet.ciiva.com/5546/dcrcwe3-109170-5546910.pdf?src-supplier=Mouser; ComponentLink2Description: https://datasheet.ciiva.com/5546/dcrcwe3-109170-5546910.pdf?src-supplier=Mouser; ComponentLink3URL: https://datasheet.ciiva.com/8968/dcrcwe3-8968743.pdf?src-supplier=Avnet; ComponentLink3Description: https://datasheet.ciiva.com/8968/dcrcwe3-8968743.pdf?src-supplier=Avnet; ComponentLink4URL: https://datasheet.ciiva.com/7695/125364-7695000.pdf?src-supplier=Element14; ComponentLink4Description: https://datasheet.ciiva.com/7695/125364-7695000.pdf?src-supplier=Element14
R25 R32 = CRCW1206100RFKEA: RES SMD 100 OHM 1% 1/4W 1206; Manufacturer: Vishay Dale; Item Type: Resistors; Power Rating: 250mW; Temperature Coefficient: 100ppm/°C; Voltage Rating: 200V; Supplier: Mouser; LCSC Part Number: C242479; Manufacturer Part Number: CRCW1206100RFKEA; RoHS: Yes; Stock: 281757; Pricing: 1=0.1, 10=0.031, 50=0.031, 100=0.019, 1000=0.017, 10000=0.011 (USD); Case/Package: 1206; Pins: 2; Contact Plating: Tin; Weight: 0.000353oz; Case Code (Imperial): 1206; Case Code (Metric): 3216; Min Operating Temperature: -55°C; Max Operating Temperature: 155°C; Value: 100R; Tolerance: 1%; Resistor Type: Thick Film; Termination: SMD/SMT; Packaging: Tape and Reel; Package Quantity: 5000; Voltage Rating (DC): 200V; Features: Automotive AEC-Q200; Max Power Dissipation: 250mW; Number of Terminations: 2; Series: CRCW; Resistance Tolerance: 1%; Construction: Rectangular; Length: 3.2mm; Width: 1.6mm; Height: 0.55mm; Depth: 1.6mm; Ratings: AEC-Q200; Radiation Hardening: No; Lead Free: Lead Free; RoHS Compliant: Yes; Reach SVHC Compliant: Unknown; Military Standard: Not
R26-R28 = CRCW1206332KFKEA: RES SMD 332K OHM 1% 1/4W 1206; Manufacturer: Vishay; Item Type: Resistor; Voltage Rating (DC): 200V; Supplier: Mouser; LCSC Part Number: C843857; Manufacturer Part Number: CRCW1206332KFKEA; RoHS: Yes; Stock: 53634; Pricing: 1=0.1, 10=0.032, 50=0.032, 100=0.019, 1000=0.015, 10000=0.009 (USD); Lead Free: 5697LeadFree; ComponentLink1URL: https://datasheet.ciiva.com/3882/41397335s9853079n6892-3882805.pdf?src-supplier=Arrow+Electronics; ComponentLink1Description: https://datasheet.ciiva.com/3882/41397335s9853079n6892-3882805.pdf?src-supplier=Arrow+Electronics; ComponentLink2URL: https://datasheet.ciiva.com/11811/0900766b80d98b5e-11811718.pdf?src-supplier=Rs; ComponentLink2Description: https://datasheet.ciiva.com/11811/0900766b80d98b5e-11811718.pdf?src-supplier=Rs; ComponentLink3URL: https://datasheet.ciiva.com/2497/dcrcwe3-2497030.pdf?src-supplier=Digikey; ComponentLink3Description: https://datasheet.ciiva.com/2497/dcrcwe3-2497030.pdf?src-supplier=Digikey; ComponentLink4URL: https://datasheet.ciiva.com/2497/dcrcwe3-2497031.pdf?src-supplier=Digikey; ComponentLink4Description: https://datasheet.ciiva.com/2497/dcrcwe3-2497031.pdf?src-supplier=Digikey; ComponentLink5URL: https://datasheet.ciiva.com/2497/dcrcwe3-2497032.pdf?src-supplier=Digikey; ComponentLink5Description: https://datasheet.ciiva.com/2497/dcrcwe3-2497032.pdf?src-supplier=Digikey; ComponentLink6URL: https://datasheet.ciiva.com/8944/dcrcwe3-8944746.pdf?src-supplier=Avnet; ComponentLink6Description: https://datasheet.ciiva.com/8944/dcrcwe3-8944746.pdf?src-supplier=Avnet; ComponentLink7URL: https://datasheet.ciiva.com/8944/dcrcwe3-8944761.pdf?src-supplier=Avnet; ComponentLink7Description: https://datasheet.ciiva.com/8944/dcrcwe3-8944761.pdf?src-supplier=Avnet; ComponentLink8URL: https://datasheet.ciiva.com/22675/125364-22675625.pdf?src-supplier=Element14; ComponentLink8Description: https://datasheet.ciiva.com/22675/125364-22675625.pdf?src-supplier=Element14; ComponentLink9URL: https://datasheet.ciiva.com/7673/1697337-7673398.pdf?src-supplier=Element14; ComponentLink9Description: https://datasheet.ciiva.com/7673/1697337-7673398.pdf?src-supplier=Element14; ComponentLink10URL: https://datasheet.ciiva.com/7673/1697337-7673512.pdf?src-supplier=Element14; ComponentLink10Description: https://datasheet.ciiva.com/7673/1697337-7673512.pdf?src-supplier=Element14; ComponentLink11URL: https://datasheet.ciiva.com/7673/1697337-7673513.pdf?src-supplier=Element14; ComponentLink11Description: https://datasheet.ciiva.com/7673/1697337-7673513.pdf?src-supplier=Element14; ComponentLink12URL: https://datasheet.ciiva.com/16762/70201119-16762524.pdf?src-supplier=Allied+Electronics; ComponentLink12Description: https://datasheet.ciiva.com/16762/70201119-16762524.pdf?src-supplier=Allied+Electronics
R30 = CRCW0603221RFKEA: RES SMD 221 OHM 1% 1/10W 0603; Manufacturer: Vishay; Item Type: Resistors; Voltage Rating (DC): 75V; Supplier: Mouser; LCSC Part Number: C844145; Manufacturer Part Number: CRCW0603221RFKEA; RoHS: Yes; Stock: 61974; Pricing: 1=0.1, 10=0.017, 50=0.017, 100=0.01, 1000=0.008, 10000=0.005 (USD); Lead Free: 5697LeadFree; ComponentLink1URL: https://datasheet.ciiva.com/11809/0900766b80d98afc-11809184.pdf?src-supplier=Rs; ComponentLink1Description: https://datasheet.ciiva.com/11809/0900766b80d98afc-11809184.pdf?src-supplier=Rs; ComponentLink2URL: https://datasheet.ciiva.com/3257/dcrcwe3-3257269.pdf?src-supplier=Avnet; ComponentLink2Description: https://datasheet.ciiva.com/3257/dcrcwe3-3257269.pdf?src-supplier=Avnet; ComponentLink3URL: https://datasheet.ciiva.com/3257/dcrcwe3-3257270.pdf?src-supplier=Avnet; ComponentLink3Description: https://datasheet.ciiva.com/3257/dcrcwe3-3257270.pdf?src-supplier=Avnet; ComponentLink4URL: https://datasheet.ciiva.com/2465/dcrcwe3-2465645.pdf?src-supplier=Digikey; ComponentLink4Description: https://datasheet.ciiva.com/2465/dcrcwe3-2465645.pdf?src-supplier=Digikey; ComponentLink5URL: https://datasheet.ciiva.com/2465/dcrcwe3-2465646.pdf?src-supplier=Digikey; ComponentLink5Description: https://datasheet.ciiva.com/2465/dcrcwe3-2465646.pdf?src-supplier=Digikey; ComponentLink6URL: https://datasheet.ciiva.com/2465/dcrcwe3-2465647.pdf?src-supplier=Digikey; ComponentLink6Description: https://datasheet.ciiva.com/2465/dcrcwe3-2465647.pdf?src-supplier=Digikey; ComponentLink7URL: https://datasheet.ciiva.com/7726/1697337-7726773.pdf?src-supplier=Element14; ComponentLink7Description: https://datasheet.ciiva.com/7726/1697337-7726773.pdf?src-supplier=Element14; ComponentLink8URL: https://datasheet.ciiva.com/7726/1533075-7726909.pdf?src-supplier=Element14; ComponentLink8Description: https://datasheet.ciiva.com/7726/1533075-7726909.pdf?src-supplier=Element14; ComponentLink9URL: https://datasheet.ciiva.com/16387/dcrcwe3-16387244.pdf?src-supplier=Future+Electronics; ComponentLink9Description: https://datasheet.ciiva.com/16387/dcrcwe3-16387244.pdf?src-supplier=Future+Electronics; ComponentLink10URL: https://datasheet.ciiva.com/16760/70201119-16760600.pdf?src-supplier=Allied+Electronics; ComponentLink10Description: https://datasheet.ciiva.com/16760/70201119-16760600.pdf?src-supplier=Allied+Electronics
R31 = RC0603FR-0749R9L: RES 49.9 OHM 1% 1/10W 0603; Manufacturer: Yageo; Temperature Coefficient: 100ppm/°C; Voltage Rating (DC): 50V; Power Rating: 100mW; Item Type: Resistor; Supplier 1: Arrow Electronics; Manufacturer Part Number: RC0603FR-0749R9L; RoHS: Yes; Category: Chip SMD Resistors; Stock 1: 2075000; Pricing 1: 5000=0.00280 (USD); Case/Package: 0603; Number of Pins: 2; Case Code (Imperial): 0603; Case Code (Metric): 1608; Size Code: 0603; Min Operating Temperature: -55°C; Max Operating Temperature: 155°C; Tolerance: 1%; Resistance: 49.9R; Resistor Type: Thick Film; Packaging: Tape and Reel; Voltage Rating: 50V; Termination: SMD/SMT; Features: Moisture Resistant; Series: RC; Max Power Dissipation: 100mW; Number of Terminations: 2; Construction: Rectangular; Resistance Tolerance: 1%; Technology: THICK FILM; Length: 1.6mm; Height: 0.45mm; Depth: 0.8mm; Lead Free: Lead Free; REACH SVHC: No SVHC; Military Standard: Not; RoHS Compliant: Yes; ComponentLink1URL: https://datasheet.ciiva.com/11808/0900766b80f96399-11808223.pdf?src-supplier=RSComponents; ComponentLink1Description: https://datasheet.ciiva.com/11808/0900766b80f96399-11808223.pdf?src-supplier=RSComponents; ComponentLink2URL: https://datasheet.ciiva.com/22747/443971-22747527.pdf?src-supplier=Element14; ComponentLink2Description: https://datasheet.ciiva.com/22747/443971-22747527.pdf?src-supplier=Element14; ComponentLink3URL: https://datasheet.ciiva.com/15189/getdatasheetpartid-325421-15189750.pdf?src-supplier=Verical; ComponentLink3Description: https://datasheet.ciiva.com/15189/getdatasheetpartid-325421-15189750.pdf?src-supplier=Verical; Supplier Part Number 1: RC0603FR-0749R9L; LCSC Part Number: C114625
R33 = CRCW060323K2FKEA: RES SMD 23.2K OHM 1% 1/10W 0603; Manufacturer: Vishay; Item Type: Resistors; Value: 23.2kR; Power Rating: 100mW; Temperature Coefficient: 100ppm/°C; Voltage Rating: 75V; Supplier: Mouser; LCSC Part Number: C844148; Manufacturer Part Number: CRCW060323K2FKEA; RoHS: Yes; Stock: 8418; Pricing: 1=0.1, 10=0.017, 50=0.017, 100=0.01, 1000=0.009, 10000=0.006 (USD); Case/Package: 0603; Pins: 2; Weight: 7.1E-05oz; Case Code (Metric): 1608; Case Code (Imperial): 0603; Contact Plating: Tin; Min Operating Temperature: -55°C; Max Operating Temperature: 155°C; Tolerance: 1%; Packaging: Tape and Reel; Package Quantity: 5000; Number of Terminations: 2; Termination: SMD/SMT; Max Power Dissipation: 100mW; Features: Automotive AEC-Q200; Series: CRCW; Resistor Type: Thick Film; Resistance Tolerance: 1%; Technology: THICK FILM; Construction: Rectangular; Length: 1.55mm; Width: 0.85mm; Height: 0.45mm; Depth: 0.85mm; Ratings: AEC-Q200; Radiation Hardening: No; Lead Free: 5697LeadFree; RoHS Compliant: Yes; Military Standard: Not; Reach SVHC Compliant: Unknown; ComponentLink1URL: https://datasheet.ciiva.com/11810/0900766b80d98afc-11810102.pdf?src-supplier=Rs; ComponentLink1Description: https://datasheet.ciiva.com/11810/0900766b80d98afc-11810102.pdf?src-supplier=Rs; ComponentLink2URL: https://datasheet.ciiva.com/7671/1533075-7671775.pdf?src-supplier=Element14; ComponentLink2Description: https://datasheet.ciiva.com/7671/1533075-7671775.pdf?src-supplier=Element14; ComponentLink3URL: https://datasheet.ciiva.com/7671/1697337-7671609.pdf?src-supplier=Element14; ComponentLink3Description: https://datasheet.ciiva.com/7671/1697337-7671609.pdf?src-supplier=Element14; ComponentLink4URL: https://datasheet.ciiva.com/2525/dcrcwe3-2525378.pdf?src-supplier=Digikey; ComponentLink4Description: https://datasheet.ciiva.com/2525/dcrcwe3-2525378.pdf?src-supplier=Digikey; ComponentLink5URL: https://datasheet.ciiva.com/2525/dcrcwe3-2525379.pdf?src-supplier=Digikey; ComponentLink5Description: https://datasheet.ciiva.com/2525/dcrcwe3-2525379.pdf?src-supplier=Digikey; ComponentLink6URL: https://datasheet.ciiva.com/22869/70201119-22869353.pdf?src-supplier=Allied+Electronics; ComponentLink6Description: https://datasheet.ciiva.com/22869/70201119-22869353.pdf?src-supplier=Allied+Electronics; ComponentLink7URL: https://datasheet.ciiva.com/5542/dcrcwe3-109170-5542813.pdf?src-supplier=Mouser; ComponentLink7Description: https://datasheet.ciiva.com/5542/dcrcwe3-109170-5542813.pdf?src-supplier=Mouser; ComponentLink8URL: https://datasheet.ciiva.com/2525/dcrcwe3-2525377.pdf?src-supplier=Digikey; ComponentLink8Description: https://datasheet.ciiva.com/2525/dcrcwe3-2525377.pdf?src-supplier=Digikey; ComponentLink9URL: https://datasheet.ciiva.com/16775/70201119-16775386.pdf?src-supplier=Allied+Electronics; ComponentLink9Description: https://datasheet.ciiva.com/16775/70201119-16775386.pdf?src-supplier=Allied+Electronics; ComponentLink10URL: https://datasheet.ciiva.com/3257/dcrcwe3-3257292.pdf?src-supplier=Avnet; ComponentLink10Description: https://datasheet.ciiva.com/3257/dcrcwe3-3257292.pdf?src-supplier=Avnet; ComponentLink11URL: https://datasheet.ciiva.com/16430/dcrcwe3-16430088.pdf?src-supplier=Future+Electronics; ComponentLink11Description: https://datasheet.ciiva.com/16430/dcrcwe3-16430088.pdf?src-supplier=Future+Electronics; ComponentLink12URL: https://datasheet.ciiva.com/3257/dcrcwe3-3257291.pdf?src-supplier=Avnet; ComponentLink12Description: https://datasheet.ciiva.com/3257/dcrcwe3-3257291.pdf?src-supplier=Avnet
R35 = CRCW120610M0JNEA: RES SMD 10M OHM 5% 1/4W 1206; Manufacturer: Vishay Dale; Item Type: Resistors; Supplier: Mouser; LCSC Part Number: C3008961; Manufacturer Part Number: CRCW120610M0JNEA; RoHS: Yes; Stock: 11008; Pricing: 1=0.1, 10=0.027, 50=0.027, 100=0.017, 1000=0.013, 10000=0.007 (USD); ComponentLink1URL: https://datasheet.ciiva.com/5548/dcrcwe3-109170-5548118.pdf?src-supplier=Mouser; ComponentLink1Description: https://datasheet.ciiva.com/5548/dcrcwe3-109170-5548118.pdf?src-supplier=Mouser; ComponentLink2URL: https://datasheet.ciiva.com/16785/70201119-16785301.pdf?src-supplier=Allied+Electronics; ComponentLink2Description: https://datasheet.ciiva.com/16785/70201119-16785301.pdf?src-supplier=Allied+Electronics; ComponentLink3URL: https://datasheet.ciiva.com/28571/1747939-28571976.pdf?src-supplier=Element14; ComponentLink3Description: https://datasheet.ciiva.com/28571/1747939-28571976.pdf?src-supplier=Element14; ComponentLink4URL: https://datasheet.ciiva.com/16385/dcrcwe3-16385852.pdf?src-supplier=Future+Electronics; ComponentLink4Description: https://datasheet.ciiva.com/16385/dcrcwe3-16385852.pdf?src-supplier=Future+Electronics; ComponentLink5URL: https://datasheet.ciiva.com/2526/dcrcwe3-2526187.pdf?src-supplier=Digikey; ComponentLink5Description: https://datasheet.ciiva.com/2526/dcrcwe3-2526187.pdf?src-supplier=Digikey; ComponentLink6URL: https://datasheet.ciiva.com/2526/dcrcwe3-2526188.pdf?src-supplier=Digikey; ComponentLink6Description: https://datasheet.ciiva.com/2526/dcrcwe3-2526188.pdf?src-supplier=Digikey; ComponentLink7URL: https://datasheet.ciiva.com/2526/dcrcwe3-2526189.pdf?src-supplier=Digikey; ComponentLink7Description: https://datasheet.ciiva.com/2526/dcrcwe3-2526189.pdf?src-supplier=Digikey; ComponentLink8URL: https://datasheet.ciiva.com/9050/dcrcwe3-9050878.pdf?src-supplier=Avnet; ComponentLink8Description: https://datasheet.ciiva.com/9050/dcrcwe3-9050878.pdf?src-supplier=Avnet
R36 = RC0603FR-0733K2L: RES 33.2K OHM 1% 1/10W 0603; Manufacturer: Yageo; Resistance: 33.2kR; Power Rating: 100mW; Voltage Rating: 50V; Temperature Coefficient: 100ppm/°C; Supplier 1: Digi-Key; Manufacturer Part Number: RC0603FR-0733K2L; RoHS: Yes; Category: Chip SMD Resistors; Stock 1: 1293262; Pricing 1: 1=0.10000, 10=0.02300, 100=0.00930, 1000=0.00417, 2500=0.00362 (USD); Mount: Surface Mount; Case/Package: 0603; Case Code (Imperial): 0603; Case Code (Metric): 1608; Size Code: 0603; Min Operating Temperature: -55°C; Max Operating Temperature: 155°C; Tolerance: 1%; Packaging: Tape and Reel; Termination: SMD/SMT; Resistor Type: Thick Film; Voltage Rating (DC): 50V; Features: Moisture Resistant; Series: RC; Max Power Dissipation: 100mW; Number of Terminations: 2; Construction: Rectangular; Technology: THICK FILM; Length: 1.6mm; Height: 0.45mm; Depth: 0.8mm; Military Standard: Not; Lead Free: Lead Free; RoHS Compliant: Yes; ComponentLink1URL: https://datasheet.ciiva.com/11808/0900766b80f96399-11808316.pdf?src-supplier=RSComponents; ComponentLink1Description: https://datasheet.ciiva.com/11808/0900766b80f96399-11808316.pdf?src-supplier=RSComponents; Supplier Part Number 1: 311-33.2KHRCT-ND; LCSC Part Number: C185338